# Altium schematic sheet MCU.SchDoc: MCU
size A4; DocumentNumber: 2; SheetNumber: 2; SheetTotal: 18
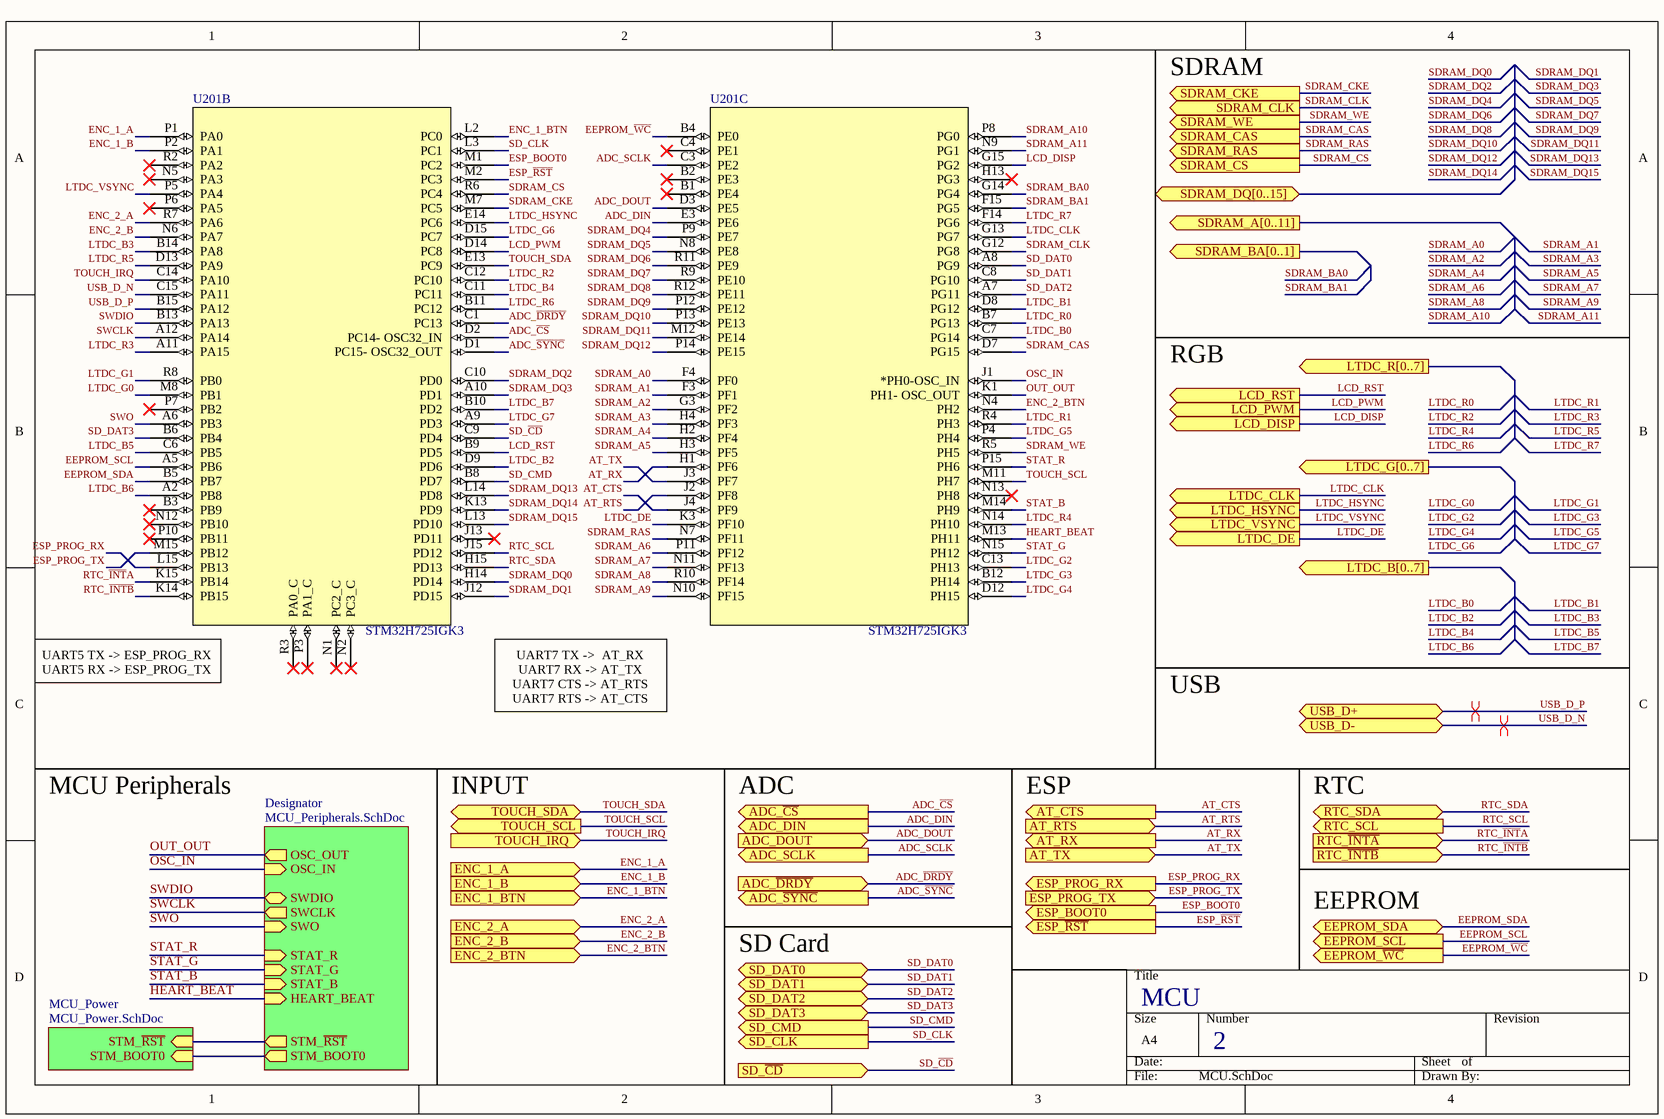
[diagram p0: MCU.SchDoc]

## Parts
U201  STM32H725IGK3  [STM32H725IGK3]  (parts B,C of 3)

## Sub-sheets
Designator = MCU_Peripherals.SchDoc: STM_BOOT0 (out), STM_~{RST} (out), OSC_IN (in), SWDIO (bidir), SWO (in), STAT_R (in), STAT_G (in), STAT_B (in), HEART_BEAT (in), OSC_OUT (out), SWCLK (out)
MCU_Power = MCU_Power.SchDoc: STM_~{RST} (in), STM_BOOT0 (in)

## Ports
ADC_DIN (out, see Top_Level[1C]), ADC_DOUT (in, see Top_Level[1C]), ADC_SCLK (out, see Top_Level[1C]), ADC_~{CS} (out, see Top_Level[1C]), ADC_~{DRDY} (in, see Top_Level[1C]), ADC_~{SYNC} (out, see Top_Level[1C]), AT_CTS (out, see Top_Level[1D], ESP32[4C]), AT_RTS (in, see Top_Level[1D], ESP32[4C]), AT_RX (out, see Top_Level[1D], ESP32[4C]), AT_TX (in, see Top_Level[1D], ESP32[4B]), EEPROM_SCL (out, see Top_Level[2D]), EEPROM_SDA (bidir, see Top_Level[2D]), EEPROM_~{WC} (out, see Top_Level[2D]), ENC_1_A (in, see Top_Level[2A], Encoders[2B]), ENC_1_B (in, see Top_Level[2A], Encoders[2B]), ENC_1_BTN (in, see Top_Level[2A], Encoders[2B]), ENC_2_A (in, see Top_Level[2A], Encoders[2A]), ENC_2_B (in, see Top_Level[2A], Encoders[2A]), ENC_2_BTN (in, see Top_Level[2A], Encoders[2B]), ESP_BOOT0 (out, see Top_Level[1D]), ESP_PROG_RX (out, see Top_Level[1D]), ESP_PROG_TX (in, see Top_Level[1D]), ESP_~{RST} (out, see Top_Level[1D]), LCD_DISP (out, see Top_Level[1A], LCD[1C]), LCD_PWM (out, see Top_Level[1A], LCD[1C]), LCD_RST (out, see Top_Level[1A], LCD[1C]), LTDC_B[0..7] (out, see Top_Level[1A], LCD[4A]), LTDC_CLK (out, see Top_Level[1A], LCD[4C]), LTDC_DE (out, see Top_Level[1B], LCD[4C]), LTDC_G[0..7] (out, see Top_Level[1A], LCD[3A]), LTDC_HSYNC (out, see Top_Level[1A], LCD[4C]), LTDC_R[0..7] (out, see Top_Level[1A], LCD[2A]), LTDC_VSYNC (out, see Top_Level[1A], LCD[1C]), RTC_SCL (out, see Top_Level[2C], Power_Sense[3B]), RTC_SDA (bidir, see Top_Level[2C], Power_Sense[3B]), RTC_~{INTA} (in, see Top_Level[2C]), RTC_~{INTB} (in, see Top_Level[2C]), SD_CLK (out, see Top_Level[2D]), SD_CMD (out, see Top_Level[2D]), SD_DAT0 (bidir, see Top_Level[2C]), SD_DAT1 (bidir, see Top_Level[2C]), SD_DAT2 (bidir, see Top_Level[2C]), SD_DAT3 (bidir, see Top_Level[2D]), SD_~{CD} (in, see Top_Level[2D]), SDRAM_A[0..11] (out, see Top_Level[1B], SDRAM[3C]), SDRAM_BA[0..1] (out, see Top_Level[1B], SDRAM[1B]), SDRAM_CAS (out, see Top_Level[1C], SDRAM[1B]), SDRAM_CKE (out, see Top_Level[1B], SDRAM[1B]), SDRAM_CLK (out, see Top_Level[1C], SDRAM[1B]), SDRAM_CS (out, see Top_Level[1C], SDRAM[1B]), SDRAM_DQ[0..15] (bidir, see Top_Level[1B], SDRAM[3A]), SDRAM_RAS (out, see Top_Level[1C], SDRAM[1B]), SDRAM_WE (out, see Top_Level[1C], SDRAM[1B]), TOUCH_IRQ (in, see Top_Level[1B], LCD[4C]), TOUCH_SCL (out, see Top_Level[1B], LCD[4C]), TOUCH_SDA (bidir, see Top_Level[1B], LCD[1C]), USB_D+ (bidir, see Top_Level[2B]), USB_D- (bidir, see Top_Level[2B])

## Nets
ADC_~{CS}: U201.D2(PC14-_OSC32_IN) ; port ADC_~{CS}
ADC_~{DRDY}: U201.C1(PC13) ; port ADC_~{DRDY}
ADC_DIN: U201.E3(PE6) ; port ADC_DIN
ADC_DOUT: U201.D3(PE5) ; port ADC_DOUT
ADC_~{SYNC}: U201.D1(PC15-_OSC32_OUT) ; port ADC_~{SYNC}
ADC_SCLK: U201.C3(PE2) ; port ADC_SCLK
AT_CTS: U201.J4(PF9) ; port AT_CTS
AT_RTS: U201.J2(PF8) ; port AT_RTS
AT_RX: U201.H1(PF6) ; port AT_RX
AT_TX: U201.J3(PF7) ; port AT_TX
EEPROM_SCL: U201.A5(PB6) ; port EEPROM_SCL
EEPROM_SDA: U201.B5(PB7) ; port EEPROM_SDA
EEPROM_~{WC}: U201.B4(PE0) ; port EEPROM_~{WC}
ENC_1_A: U201.P1(PA0) ; port ENC_1_A
ENC_1_B: U201.P2(PA1) ; port ENC_1_B
ENC_1_BTN: U201.L2(PC0) ; port ENC_1_BTN
ENC_2_A: U201.R7(PA6) ; port ENC_2_A
ENC_2_B: U201.N6(PA7) ; port ENC_2_B
ENC_2_BTN: U201.N4(PH2) ; port ENC_2_BTN
ESP_BOOT0: U201.M1(PC2) ; port ESP_BOOT0
ESP_PROG_RX: U201.L15(PB13) ; port ESP_PROG_RX
ESP_PROG_TX: U201.M15(PB12) ; port ESP_PROG_TX
ESP_~{RST}: U201.M2(PC3) ; port ESP_~{RST}
HEART_BEAT: U201.M13(PH11) ; sheet Designator/HEART_BEAT
LCD_DISP: U201.G15(PG2) ; port LCD_DISP
LCD_PWM: U201.D14(PC8) ; port LCD_PWM
LCD_RST: U201.B9(PD5) ; port LCD_RST
LTDC_B0: U201.C7(PG14)
LTDC_B1: U201.D8(PG12)
LTDC_B2: U201.D9(PD6)
LTDC_B3: U201.B14(PA8)
LTDC_B4: U201.C11(PC11)
LTDC_B5: U201.C6(PB5)
LTDC_B6: U201.A2(PB8)
LTDC_B7: U201.B10(PD2)
LTDC_CLK: U201.G13(PG7) ; port LTDC_CLK
LTDC_DE: U201.K3(PF10) ; port LTDC_DE
LTDC_G0: U201.M8(PB1)
LTDC_G1: U201.R8(PB0)
LTDC_G2: U201.C13(PH13)
LTDC_G3: U201.B12(PH14)
LTDC_G4: U201.D12(PH15)
LTDC_G5: U201.P4(PH4)
LTDC_G6: U201.D15(PC7)
LTDC_G7: U201.A9(PD3)
LTDC_HSYNC: U201.E14(PC6) ; port LTDC_HSYNC
LTDC_R0: U201.B7(PG13)
LTDC_R1: U201.R4(PH3)
LTDC_R2: U201.C12(PC10)
LTDC_R3: U201.A11(PA15)
LTDC_R4: U201.N14(PH10)
LTDC_R5: U201.D13(PA9)
LTDC_R6: U201.B11(PC12)
LTDC_R7: U201.F14(PG6)
LTDC_VSYNC: U201.P5(PA4) ; port LTDC_VSYNC
OSC_IN: U201.J1(*PH0-OSC_IN) ; sheet Designator/OSC_IN
OUT_OUT: U201.K1(PH1-_OSC_OUT) ; sheet Designator/OSC_OUT
RTC_~{INT}A: U201.K15(PB14) ; port RTC_~{INTA}
RTC_~{INTB}: U201.K14(PB15) ; port RTC_~{INTB}
RTC_SCL: U201.J15(PD12) ; port RTC_SCL
RTC_SDA: U201.H15(PD13) ; port RTC_SDA
SD_~{CD}: U201.C9(PD4) ; port SD_~{CD}
SD_CLK: U201.L3(PC1) ; port SD_CLK
SD_CMD: U201.B8(PD7) ; port SD_CMD
SD_DAT0: U201.A8(PG9) ; port SD_DAT0
SD_DAT1: U201.C8(PG10) ; port SD_DAT1
SD_DAT2: U201.A7(PG11) ; port SD_DAT2
SD_DAT3: U201.B6(PB4) ; port SD_DAT3
SDRAM_A0: U201.F4(PF0)
SDRAM_A1: U201.F3(PF1)
SDRAM_A2: U201.G3(PF2)
SDRAM_A3: U201.H4(PF3)
SDRAM_A4: U201.H2(PF4)
SDRAM_A5: U201.H3(PF5)
SDRAM_A6: U201.P11(PF12)
SDRAM_A7: U201.N11(PF13)
SDRAM_A8: U201.R10(PF14)
SDRAM_A9: U201.N10(PF15)
SDRAM_A10: U201.P8(PG0)
SDRAM_A11: U201.N9(PG1)
SDRAM_BA0: U201.G14(PG4)
SDRAM_BA1: U201.F15(PG5)
SDRAM_CAS: U201.D7(PG15) ; port SDRAM_CAS
SDRAM_CKE: U201.M7(PC5) ; port SDRAM_CKE
SDRAM_CLK: U201.G12(PG8) ; port SDRAM_CLK
SDRAM_CS: U201.R6(PC4) ; port SDRAM_CS
SDRAM_DQ0: U201.H14(PD14)
SDRAM_DQ1: U201.J12(PD15)
SDRAM_DQ2: U201.C10(PD0)
SDRAM_DQ3: U201.A10(PD1)
SDRAM_DQ4: U201.P9(PE7)
SDRAM_DQ5: U201.N8(PE8)
SDRAM_DQ6: U201.R11(PE9)
SDRAM_DQ7: U201.R9(PE10)
SDRAM_DQ8: U201.R12(PE11)
SDRAM_DQ9: U201.P12(PE12)
SDRAM_DQ10: U201.P13(PE13)
SDRAM_DQ11: U201.M12(PE14)
SDRAM_DQ12: U201.P14(PE15)
SDRAM_DQ13: U201.L14(PD8)
SDRAM_DQ14: U201.K13(PD9)
SDRAM_DQ15: U201.L13(PD10)
SDRAM_RAS: U201.N7(PF11) ; port SDRAM_RAS
SDRAM_WE: U201.R5(PH5) ; port SDRAM_WE
STAT_B: U201.M14(PH9) ; sheet Designator/STAT_B
STAT_G: U201.N15(PH12) ; sheet Designator/STAT_G
STAT_R: U201.P15(PH6) ; sheet Designator/STAT_R
SWCLK: U201.A12(PA14) ; sheet Designator/SWCLK
SWDIO: U201.B13(PA13) ; sheet Designator/SWDIO
SWO: U201.A6(PB3) ; sheet Designator/SWO
TOUCH_IRQ: U201.C14(PA10) ; port TOUCH_IRQ
TOUCH_SCL: U201.M11(PH7) ; port TOUCH_SCL
TOUCH_SDA: U201.E13(PC9) ; port TOUCH_SDA
USB_D_N: U201.C15(PA11) ; port USB_D-
USB_D_P: U201.B15(PA12) ; port USB_D+
(unnamed): sheet Designator/STM_BOOT0, sheet MCU_Power/STM_BOOT0
(unnamed): sheet Designator/STM_~{RST}, sheet MCU_Power/STM_~{RST}

Not connected (* = marked no-connect by the designer): U201 B1(PE4)* B2(PE3)* B3(PB9)* C4(PE1)* H13(PG3)* J13(PD11)* N1(PC2_C)* N2(PC3_C)* N5(PA3)* N12(PB10)* N13(PH8)* P3(PA1_C)* P6(PA5)* P7(PB2)* P10(PB11)* R2(PA2)* R3(PA0_C)*

## Layout directives
differential pair: USB_D_N, USB_D_P

## Notes on the sheet
- SDRAM
- RGB
- (near U201) UART5 TX -> ESP_PROG_RX
  UART5 RX -> ESP_PROG_TX
- (near U201) UART7 TX ->  AT_RX
  UART7 RX -> AT_TX
  UART7 CTS -> AT_RTS
  UART7 RTS -> AT_CTS
- USB
- MCU Peripherals
- INPUT
- ADC
- ESP
- RTC
- SD Card
- EEPROM

## Library data of the parts
U201 = STM32H725IGK3: High-performance and DSP with DP-FPU, Arm Cortex-M7 MCU with 1 MByte Flash, 564 KBytes RAM, 550 MHz CPU, L1 cache, external memory interface, SMPS, subset of peripherals; Manufacturer_Name: STMicroelectronics; Manufacturer_Part_Number: STM32H725IGK3; RefDes: RefDes; Type: Type; Supplier 1: Future Electronics; Supplier Part Number 1: STM32H725IGK3